# Altium schematic sheet Adquicision_Analogica.SchDoc
size A4; SheetNumber: 16; SheetTotal: 16
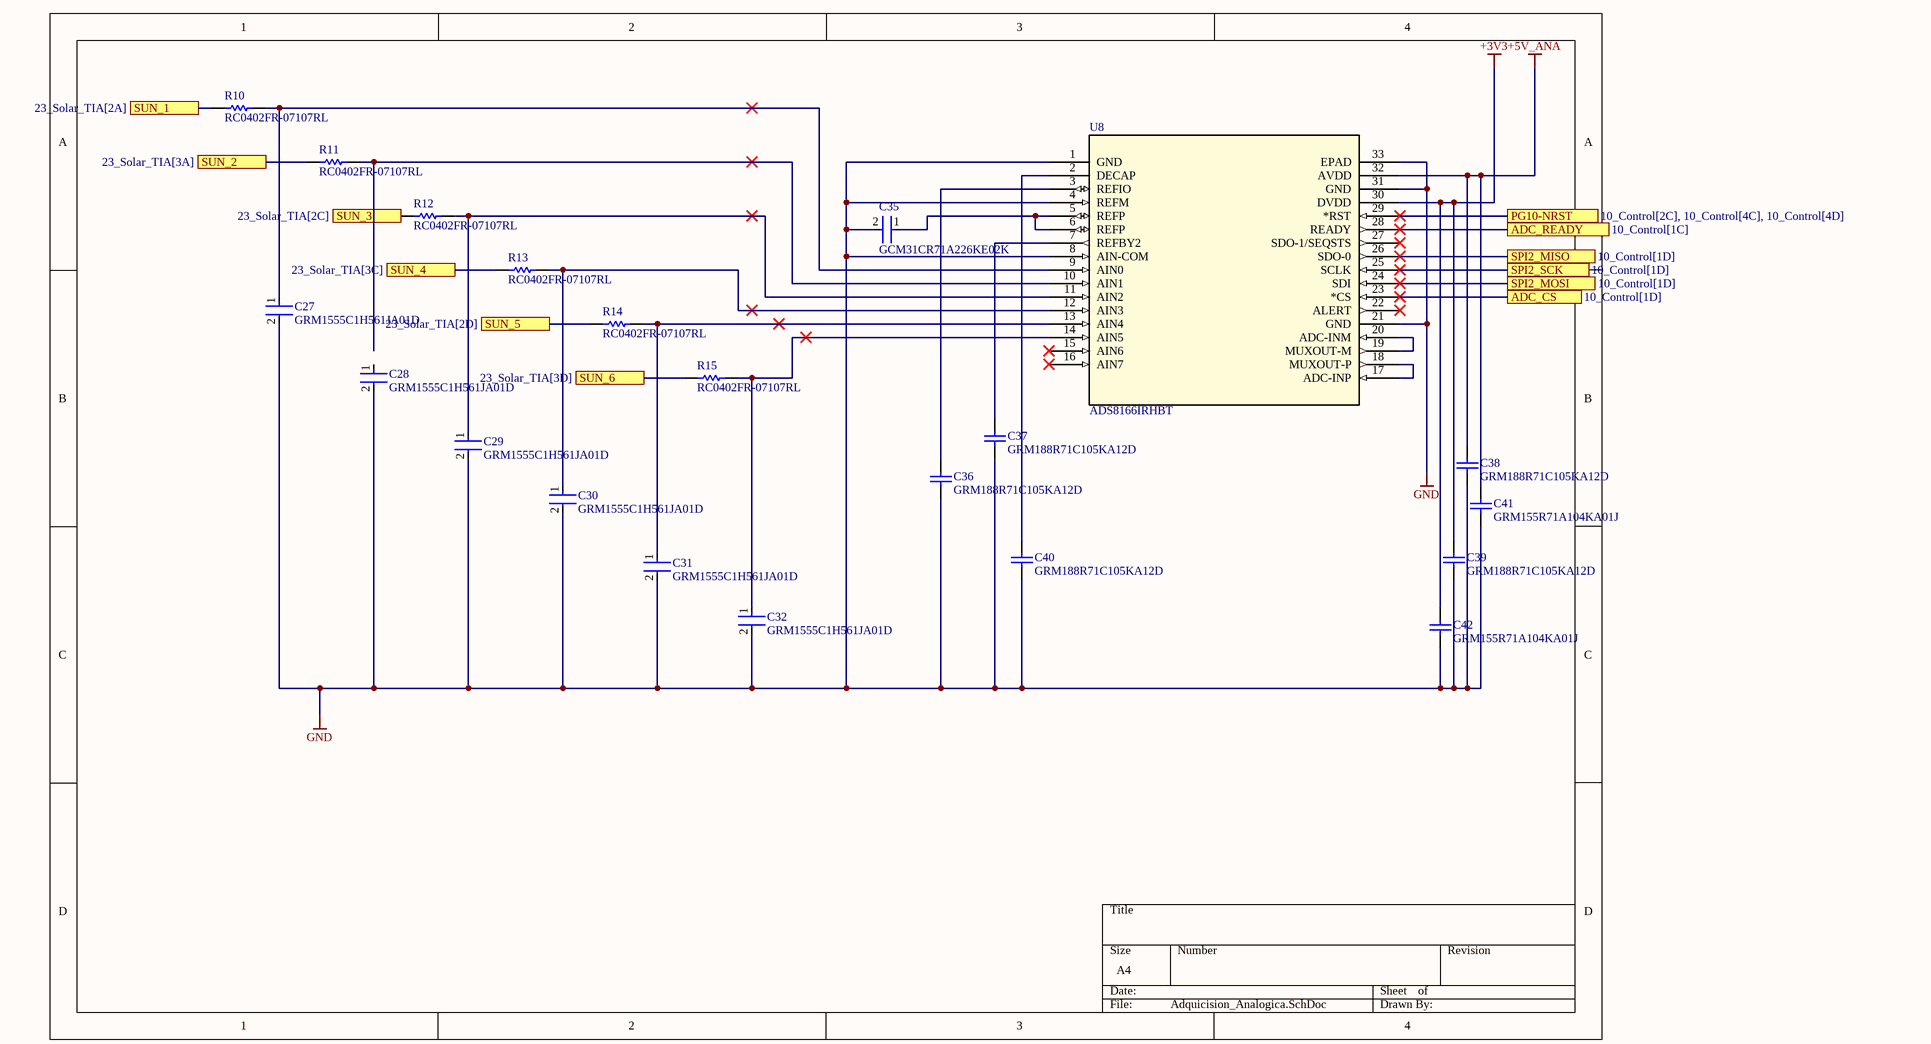
[diagram p0: Adquicision_Analogica.SchDoc]

## Parts
C27  GRM1555C1H561JA01D  [FP-GRM155-0_05-IPC_C]
C28  GRM1555C1H561JA01D  [FP-GRM155-0_05-IPC_C]
C29  GRM1555C1H561JA01D  [FP-GRM155-0_05-IPC_C]
C30  GRM1555C1H561JA01D  [FP-GRM155-0_05-IPC_C]
C31  GRM1555C1H561JA01D  [FP-GRM155-0_05-IPC_C]
C32  GRM1555C1H561JA01D  [FP-GRM155-0_05-IPC_C]
C35  GCM31CR71A226KE02K  [FP-GCM31C-0_2-e0_3_0_8-IPC_A]
C36  GRM188R71C105KA12D  [CAPC1608X90X35ML10T15]
C37  GRM188R71C105KA12D  [CAPC1608X90X35ML10T15]
C38  GRM188R71C105KA12D  [CAPC1608X90X35ML10T15]
C39  GRM188R71C105KA12D  [CAPC1608X90X35ML10T15]
C40  GRM188R71C105KA12D  [CAPC1608X90X35ML10T15]
C41  GRM155R71A104KA01J  [CAPC1005X55X25ML05T10]
C42  GRM155R71A104KA01J  [CAPC1005X55X25ML05T10]
R10  RC0402FR-07107RL  [RESC1005X40X25ML05T10]
R11  RC0402FR-07107RL  [RESC1005X40X25ML05T10]
R12  RC0402FR-07107RL  [RESC1005X40X25ML05T10]
R13  RC0402FR-07107RL  [RESC1005X40X25ML05T10]
R14  RC0402FR-07107RL  [RESC1005X40X25ML05T10]
R15  RC0402FR-07107RL  [RESC1005X40X25ML05T10]
U8  ADS8166IRHBT  [RHB32_TEX]

## Ports
ADC_CS (see 10_Control[1D]), ADC_READY (see 10_Control[1C]), PG10-NRST (see 10_Control[2C], 10_Control[4C], 10_Control[4D]), SPI2_MISO (see 10_Control[1D]), SPI2_MOSI (see 10_Control[1D]), SPI2_SCK (see 10_Control[1D]), SUN_1 (see 23_Solar_TIA[2A]), SUN_2 (see 23_Solar_TIA[3A]), SUN_3 (see 23_Solar_TIA[2C]), SUN_4 (see 23_Solar_TIA[3C]), SUN_5 (see 23_Solar_TIA[2D]), SUN_6 (see 23_Solar_TIA[3D])

## Nets
+3V3: C39.2 C42.1 U8.30(DVDD)
+5V_ANA: C38.2 C41.2 U8.32(AVDD)
GND: C27.2 C28.2 C29.2 C30.2 C31.2 C32.2 C35.2 C36.1 C37.1 C38.1 C39.1 C40.1 C41.1 C42.2 U8.1(GND) U8.4(REFM) U8.8(AIN-COM) U8.21(GND) U8.31(GND) U8.33(EPAD)
ADC_CS: U8.23(*CS) ; port ADC_CS
ADC_READY: U8.28(READY) ; port ADC_READY
PG10-NRST: U8.29(*RST) ; port PG10-NRST
SPI2_MISO: U8.26(SDO-0) ; port SPI2_MISO
SPI2_MOSI: U8.24(SDI) ; port SPI2_MOSI
SPI2_SCK: U8.25(SCLK) ; port SPI2_SCK
SUN_1: R10.1 ; port SUN_1
SUN_2: R11.1 ; port SUN_2
SUN_3: R12.1 ; port SUN_3
SUN_4: R13.1 ; port SUN_4
SUN_5: R14.1 ; port SUN_5
SUN_6: R15.1 ; port SUN_6
NetC27_1: C27.1 R10.2 U8.9(AIN0)
NetC29_1: C29.1 R12.2 U8.11(AIN2)
NetC30_1: C30.1 R13.2 U8.12(AIN3)
NetC31_1: C31.1 R14.2 U8.13(AIN4)
NetC32_1: C32.1 R15.2 U8.14(AIN5)
NetC35_1: C35.1 U8.5(REFP) U8.6(REFP)
NetC36_2: C36.2 U8.3(REFIO)
NetC37_2: C37.2 U8.7(REFBY2)
NetC40_2: C40.2 U8.2(DECAP)
NetR11_2: R11.2 U8.10(AIN1)
NetU8_17: U8.17(ADC-INP) U8.18(MUXOUT-P)
NetU8_19: U8.19(MUXOUT-M) U8.20(ADC-INM)

Not connected (* = marked no-connect by the designer): C28 1; U8 15(AIN6)* 16(AIN7)* 22(ALERT)* 27(SDO-1/SEQSTS)*

## Library data of the parts
C27-C32 = CMP-2008-04388-2: Chip Multilayer Ceramic Capacitors for General Purpose, 0402, 560pF, C0G, 30ppm/°C, 5%, 50V; Temperature Coefficient: 30ppm/°C; Dielectric: C0G; Termination: SMD/SMT; Width: 0.02inch; Thickness: 0.022inch; Capacitance: 560pF; Min Operating Temperature: -55°C; Case/Package: 0402; Mount: Surface Mount; Voltage Rating: 50V; Depth: 0.5mm; Voltage: 50V; Material: Ceramic; Voltage Rating (DC): 50V; Radiation Hardening: No; REACH SVHC: No SVHC; Case Code (Metric): 1005; Case Code (Imperial): 0402; Max Operating Temperature: 125°C; Length: 1mm; Package Quantity: 1; Tolerance: 5%; Lead Free: Lead Free; Packaging: Tape and Reel; Height: 0.5mm
C35 = CMP-06035-059468-1: Ceramic Capacitor for Automotive 22uF ±10% 10VDC X7R 1206 Embossed T/R
C36-C40 = CMP-2006-02845-1: Manufacturer: Murata; Part Number: GRM188R71C105KA12D
C41 C42 = CMP-2008-04031-1: Manufacturer: Murata; Part Number: GRM155R71A104KA01J
R10-R15 = CMP-2002-07349-1: Manufacturer: Yageo / Phycomp; Part Number: RC0402FR-07107RL
U8 = ADS8166IRHBT: 16-bit, 250-kSPS, 8-ch SAR ADC with VREF, VREF buffer and direct sensor interface 32-VQFN -40 to 125; Manufacturer_Name: Texas Instruments; Copyright: Copyright (C) 2025 Ultra Librarian. All rights reserved.; Manufacturer_Part_Number: ADS8166IRHBT; RefDes: RefDes; Type: Type